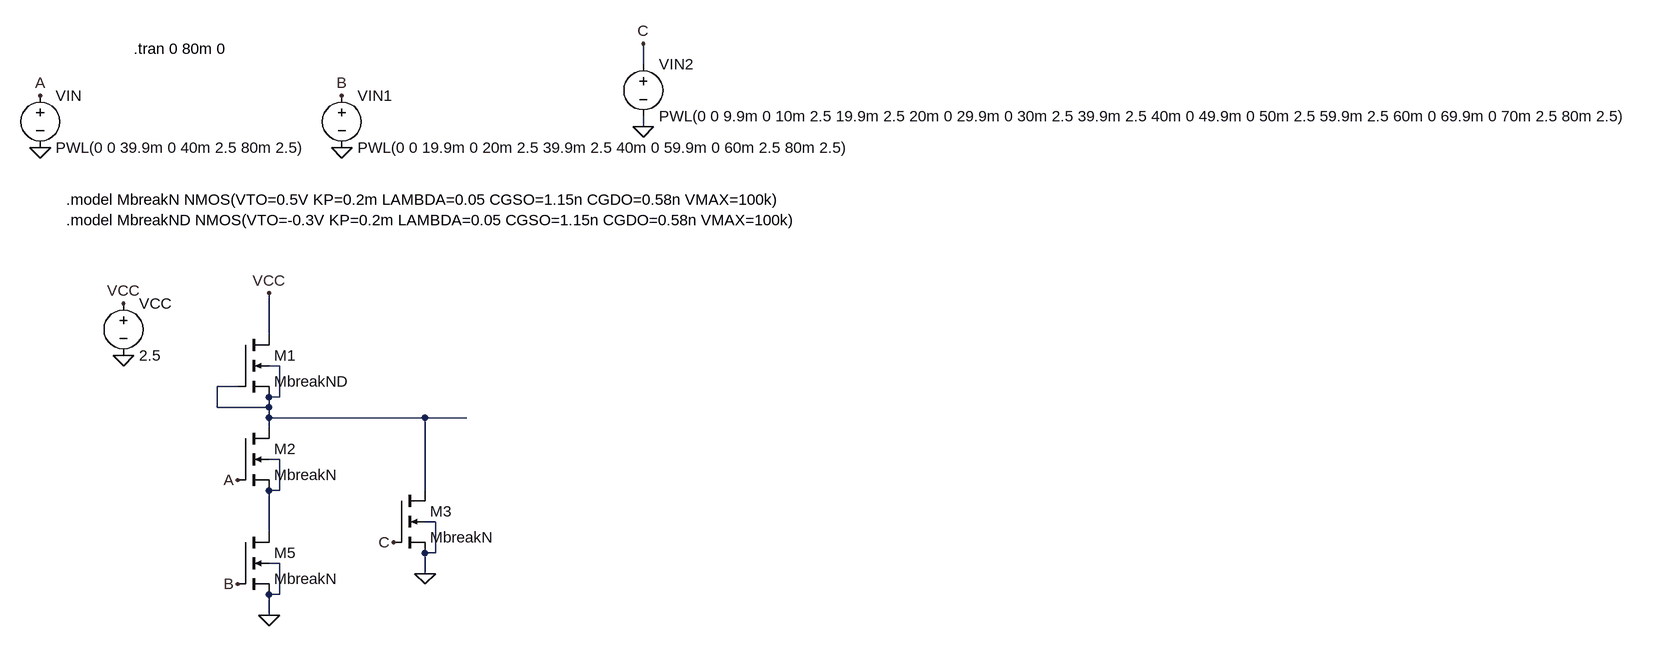
[diagram p0: schematic I_5.asc]
I_5.asc, the LTspice schematic file:
Version 4.1
SHEET 1 2548 856
WIRE 896 -304 896 -336
WIRE 896 -208 896 -224
WIRE 320 112 320 48
WIRE 336 160 320 160
WIRE 272 192 240 192
WIRE 336 208 336 160
WIRE 336 208 320 208
WIRE 240 224 240 192
WIRE 320 224 320 208
WIRE 320 224 240 224
WIRE 320 240 320 224
WIRE 560 240 320 240
WIRE 624 240 560 240
WIRE 320 256 320 240
WIRE 336 304 320 304
WIRE 336 352 336 304
WIRE 336 352 320 352
WIRE 560 352 560 240
WIRE 576 400 560 400
WIRE 320 416 320 352
WIRE 576 448 576 400
WIRE 576 448 560 448
WIRE 336 464 320 464
WIRE 560 480 560 448
WIRE 336 512 336 464
WIRE 336 512 320 512
WIRE 320 544 320 512
FLAG 96 144 0
FLAG 96 64 VCC
FLAG 320 48 VCC
FLAG -32 -176 0
FLAG -32 -256 A
FLAG 272 336 A
FLAG 320 544 0
FLAG 432 -176 0
FLAG 432 -256 B
FLAG 896 -208 0
FLAG 896 -336 C
FLAG 272 496 B
FLAG 560 480 0
FLAG 512 432 C
SYMBOL voltage 96 48 R0
WINDOW 123 0 0 Left 0
WINDOW 39 0 0 Left 0
SYMATTR InstName VCC
SYMATTR Value 2.5
SYMBOL voltage -32 -272 R0
WINDOW 123 0 0 Left 0
WINDOW 39 0 0 Left 0
SYMATTR InstName VIN
SYMATTR Value PWL(0 0 39.9m 0 40m 2.5 80m 2.5)
SYMBOL nmos4 272 112 R0
SYMATTR InstName M1
SYMATTR Value MbreakND
SYMATTR Value2 l=2u w=0.5u
SYMBOL nmos4 272 256 R0
SYMATTR InstName M2
SYMATTR Value MbreakN
SYMATTR Value2 l=1.5u w=0.5u
SYMBOL nmos4 272 416 R0
SYMATTR InstName M5
SYMATTR Value MbreakN
SYMATTR Value2 l=1.5u w=0.5u
SYMBOL voltage 432 -272 R0
WINDOW 123 0 0 Left 0
WINDOW 39 0 0 Left 0
SYMATTR InstName VIN1
SYMATTR Value PWL(0 0 19.9m 0 20m 2.5 39.9m 2.5 40m 0 59.9m 0 60m 2.5 80m 2.5)
SYMBOL voltage 896 -320 R0
WINDOW 123 0 0 Left 0
WINDOW 39 0 0 Left 0
SYMATTR InstName VIN2
SYMATTR Value PWL(0 0 9.9m 0 10m 2.5 19.9m 2.5 20m 0 29.9m 0 30m 2.5 39.9m 2.5 40m 0 49.9m 0 50m 2.5 59.9m 2.5 60m 0 69.9m 0 70m 2.5 80m 2.5)
SYMBOL nmos4 512 352 R0
SYMATTR InstName M3
SYMATTR Value MbreakN
SYMATTR Value2 l=1.5u w=0.5u
TEXT 8 -96 Left 2 !.model MbreakN NMOS(VTO=0.5V KP=0.2m LAMBDA=0.05 CGSO=1.15n CGDO=0.58n VMAX=100k)
TEXT 8 -64 Left 2 !.model MbreakND NMOS(VTO=-0.3V KP=0.2m LAMBDA=0.05 CGSO=1.15n CGDO=0.58n VMAX=100k)
TEXT 112 -328 Left 2 !.tran 0 80m 0

The netlist it stands for:
* I_5.asc
VCC VCC 0 2.5
VIN A 0 PWL(0 0 39.9m 0 40m 2.5 80m 2.5)
M1 VCC N001 N001 N001 MbreakND l=2u w=0.5u
M2 N001 A N002 N002 MbreakN l=1.5u w=0.5u
M5 N002 B 0 0 MbreakN l=1.5u w=0.5u
VIN1 B 0 PWL(0 0 19.9m 0 20m 2.5 39.9m 2.5 40m 0 59.9m 0 60m 2.5 80m 2.5)
VIN2 C 0 PWL(0 0 9.9m 0 10m 2.5 19.9m 2.5 20m 0 29.9m 0 30m 2.5 39.9m 2.5 40m 0 49.9m 0 50m 2.5 59.9m 2.5 60m 0 69.9m 0 70m 2.5 80m 2.5)
M3 N001 C 0 0 MbreakN l=1.5u w=0.5u
.model NMOS NMOS
.model PMOS PMOS
.lib standard.mos
.model MbreakN NMOS(VTO=0.5V KP=0.2m LAMBDA=0.05 CGSO=1.15n CGDO=0.58n VMAX=100k)
.model MbreakND NMOS(VTO=-0.3V KP=0.2m LAMBDA=0.05 CGSO=1.15n CGDO=0.58n VMAX=100k)
.tran 0 80m 0
.backanno
.end